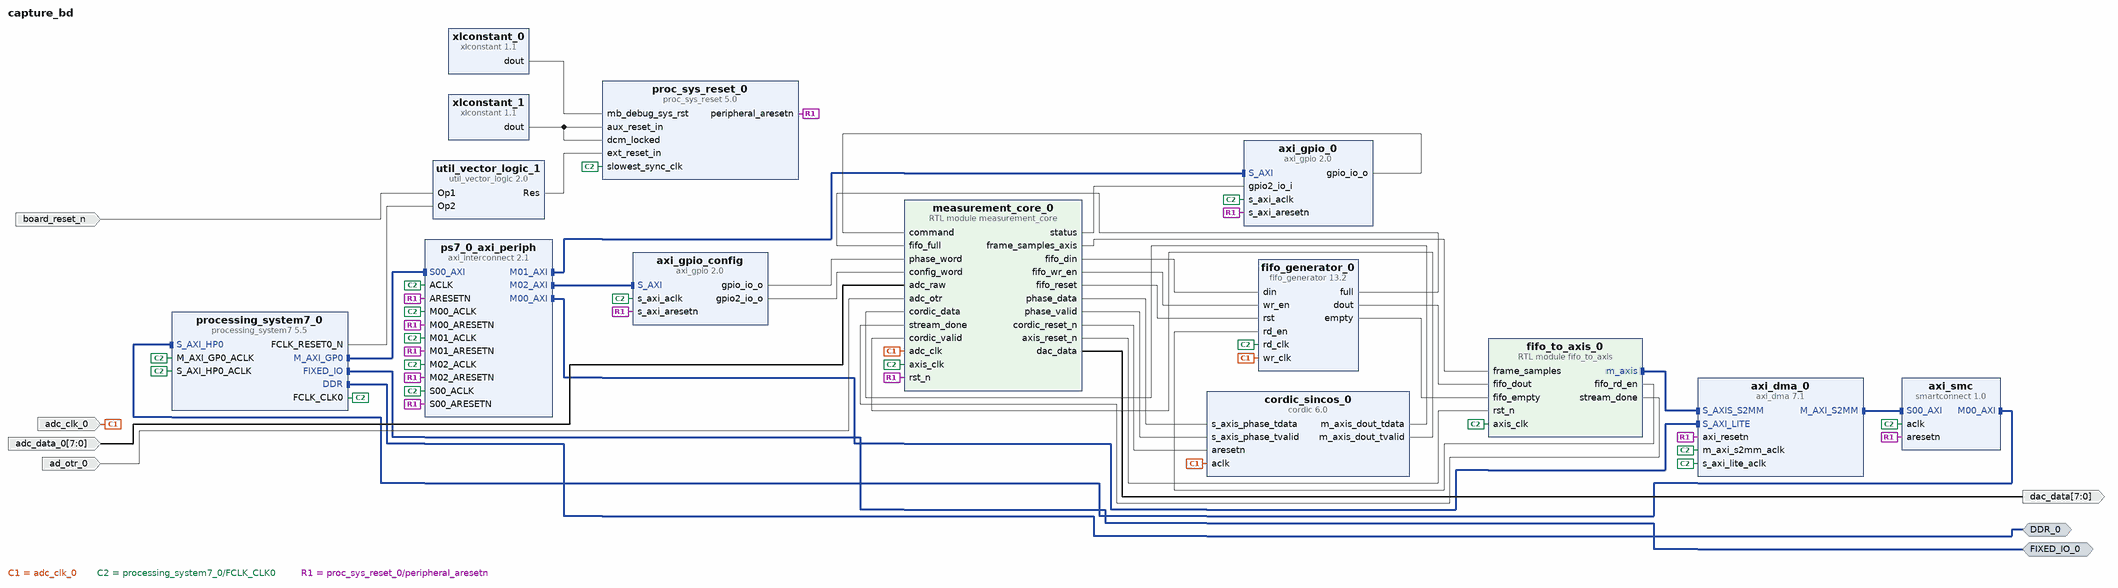
[diagram p0: block diagram of the top level]
# Vivado block design capture_bd, xc7z035ffg900-2, Vivado 2018.3
create_bd_design capture_bd

create_bd_intf_port -mode Master -vlnv xilinx.com:interface:ddrx_rtl:1.0 DDR_0
create_bd_intf_port -mode Master -vlnv xilinx.com:display_processing_system7:fixedio_rtl:1.0 FIXED_IO_0
create_bd_port -dir I -type clk adc_clk_0
set_property -dict {CONFIG.CLK_DOMAIN capture_bd_adc_clk_0 CONFIG.FREQ_HZ 10000000} [get_bd_ports adc_clk_0]
create_bd_port -dir I -from 7 -to 0 adc_data_0
create_bd_port -dir I -type rst board_reset_n
set_property -dict {CONFIG.POLARITY ACTIVE_LOW} [get_bd_ports board_reset_n]
create_bd_port -dir I ad_otr_0
create_bd_port -dir O -from 7 -to 0 dac_data

create_bd_cell -type ip -vlnv xilinx.com:ip:fifo_generator:13.2 fifo_generator_0
set_property -dict [list \
  CONFIG.Fifo_Implementation Independent_Clocks_Builtin_FIFO \
  CONFIG.Input_Data_Width 32 \
  CONFIG.Performance_Options First_Word_Fall_Through \
] [get_bd_cells fifo_generator_0]
create_bd_cell -type ip -vlnv xilinx.com:ip:axi_dma:7.1 axi_dma_0
set_property -dict {CONFIG.c_include_mm2s 0 CONFIG.c_include_sg 0} [get_bd_cells axi_dma_0]
create_bd_cell -type ip -vlnv xilinx.com:ip:processing_system7:5.5 processing_system7_0
set_property -dict [list \
  CONFIG.PCW_FPGA0_PERIPHERAL_FREQMHZ 100 \
  CONFIG.PCW_PRESET_BANK1_VOLTAGE {LVCMOS 3.3V} \
  CONFIG.PCW_S_AXI_HP0_DATA_WIDTH 32 \
  CONFIG.PCW_UART0_PERIPHERAL_ENABLE 1 \
  CONFIG.PCW_UART0_UART0_IO {MIO 14 .. 15} \
  CONFIG.PCW_UART_PERIPHERAL_FREQMHZ 100 \
  CONFIG.PCW_UIPARAM_DDR_FREQ_MHZ 533.333333 \
  CONFIG.PCW_UIPARAM_DDR_MEMORY_TYPE {DDR 3 (Low Voltage)} \
  CONFIG.PCW_UIPARAM_DDR_PARTNO {MT41K256M16 RE-125} \
  CONFIG.PCW_USE_S_AXI_HP0 1 \
] [get_bd_cells processing_system7_0]
# 97 more settings of processing_system7_0 are not shown: defaults, MIO pin electricals, DDR timing, and values the tool derives
create_bd_cell -type ip -vlnv xilinx.com:ip:proc_sys_reset:5.0 proc_sys_reset_0
create_bd_cell -type ip -vlnv xilinx.com:ip:util_vector_logic:2.0 util_vector_logic_1
set_property -dict {CONFIG.C_SIZE 1} [get_bd_cells util_vector_logic_1]
create_bd_cell -type ip -vlnv xilinx.com:ip:xlconstant:1.1 xlconstant_0
set_property -dict {CONFIG.CONST_VAL 0} [get_bd_cells xlconstant_0]
create_bd_cell -type ip -vlnv xilinx.com:ip:xlconstant:1.1 xlconstant_1
set_property -dict {CONFIG.CONST_VAL 1} [get_bd_cells xlconstant_1]
create_bd_cell -type ip -vlnv xilinx.com:ip:axi_interconnect:2.1 ps7_0_axi_periph
set_property -dict {CONFIG.NUM_MI 3} [get_bd_cells ps7_0_axi_periph]
create_bd_cell -type ip -vlnv xilinx.com:ip:smartconnect:1.0 axi_smc
set_property -dict {CONFIG.NUM_SI 1} [get_bd_cells axi_smc]
create_bd_cell -type ip -vlnv xilinx.com:ip:axi_gpio:2.0 axi_gpio_0
set_property -dict [list \
  CONFIG.C_ALL_INPUTS_2 1 \
  CONFIG.C_ALL_OUTPUTS 1 \
  CONFIG.C_GPIO2_WIDTH 32 \
  CONFIG.C_GPIO_WIDTH 32 \
  CONFIG.C_IS_DUAL 1 \
] [get_bd_cells axi_gpio_0]
create_bd_cell -type ip -vlnv xilinx.com:ip:cordic:6.0 cordic_sincos_0
set_property -dict [list \
  CONFIG.ARESETN true \
  CONFIG.Architectural_Configuration Parallel \
  CONFIG.Coarse_Rotation true \
  CONFIG.Functional_Selection Sin_and_Cos \
  CONFIG.Input_Width 16 \
  CONFIG.Output_Width 16 \
  CONFIG.Phase_Format Scaled_Radians \
  CONFIG.Pipelining_Mode Maximum \
  CONFIG.Round_Mode Nearest_Even \
  CONFIG.flow_control NonBlocking \
] [get_bd_cells cordic_sincos_0]
create_bd_cell -type ip -vlnv xilinx.com:ip:axi_gpio:2.0 axi_gpio_config
set_property -dict [list \
  CONFIG.C_ALL_OUTPUTS 1 \
  CONFIG.C_ALL_OUTPUTS_2 1 \
  CONFIG.C_GPIO2_WIDTH 32 \
  CONFIG.C_GPIO_WIDTH 32 \
  CONFIG.C_IS_DUAL 1 \
] [get_bd_cells axi_gpio_config]
create_bd_cell -type module -reference measurement_core measurement_core_0
create_bd_cell -type module -reference fifo_to_axis fifo_to_axis_0

# ---- connections ----

connect_bd_intf_net [get_bd_intf_pins ps7_0_axi_periph/M02_AXI] [get_bd_intf_pins axi_gpio_config/S_AXI]
connect_bd_intf_net [get_bd_intf_pins axi_dma_0/M_AXI_S2MM] [get_bd_intf_pins axi_smc/S00_AXI]
connect_bd_intf_net [get_bd_intf_pins ps7_0_axi_periph/M01_AXI] [get_bd_intf_pins axi_gpio_0/S_AXI]
connect_bd_intf_net [get_bd_intf_pins fifo_to_axis_0/m_axis] [get_bd_intf_pins axi_dma_0/S_AXIS_S2MM]
connect_bd_intf_net [get_bd_intf_pins axi_smc/M00_AXI] [get_bd_intf_pins processing_system7_0/S_AXI_HP0]
connect_bd_intf_net [get_bd_intf_pins ps7_0_axi_periph/M00_AXI] [get_bd_intf_pins axi_dma_0/S_AXI_LITE]
connect_bd_intf_net [get_bd_intf_pins processing_system7_0/M_AXI_GP0] [get_bd_intf_pins ps7_0_axi_periph/S00_AXI]
connect_bd_intf_net [get_bd_intf_ports FIXED_IO_0] [get_bd_intf_pins processing_system7_0/FIXED_IO]
connect_bd_intf_net [get_bd_intf_ports DDR_0] [get_bd_intf_pins processing_system7_0/DDR]
connect_bd_net -net adc_capture_pack_0_fifo_din [get_bd_pins measurement_core_0/fifo_din] [get_bd_pins fifo_generator_0/din]
connect_bd_net -net adc_capture_pack_0_fifo_wr_en [get_bd_pins measurement_core_0/fifo_wr_en] [get_bd_pins fifo_generator_0/wr_en]
connect_bd_net [get_bd_pins fifo_generator_0/full] [get_bd_pins measurement_core_0/fifo_full]
connect_bd_net -net adc_clk_0_1 [get_bd_ports adc_clk_0] \
  [get_bd_pins fifo_generator_0/wr_clk] [get_bd_pins cordic_sincos_0/aclk] [get_bd_pins measurement_core_0/adc_clk]
connect_bd_net -net adc_data_0_1 [get_bd_ports adc_data_0] [get_bd_pins measurement_core_0/adc_raw]
connect_bd_net [get_bd_pins fifo_generator_0/dout] [get_bd_pins fifo_to_axis_0/fifo_dout]
connect_bd_net [get_bd_pins fifo_generator_0/empty] [get_bd_pins fifo_to_axis_0/fifo_empty]
connect_bd_net [get_bd_pins fifo_to_axis_0/fifo_rd_en] [get_bd_pins fifo_generator_0/rd_en]
connect_bd_net [get_bd_pins processing_system7_0/FCLK_CLK0] \
  [get_bd_pins processing_system7_0/M_AXI_GP0_ACLK] [get_bd_pins processing_system7_0/S_AXI_HP0_ACLK] \
  [get_bd_pins axi_dma_0/s_axi_lite_aclk] [get_bd_pins axi_dma_0/m_axi_s2mm_aclk] [get_bd_pins fifo_generator_0/rd_clk] \
  [get_bd_pins proc_sys_reset_0/slowest_sync_clk] [get_bd_pins ps7_0_axi_periph/ACLK] [get_bd_pins ps7_0_axi_periph/S00_ACLK] \
  [get_bd_pins ps7_0_axi_periph/M00_ACLK] [get_bd_pins axi_smc/aclk] [get_bd_pins axi_gpio_0/s_axi_aclk] \
  [get_bd_pins ps7_0_axi_periph/M01_ACLK] [get_bd_pins axi_gpio_config/s_axi_aclk] [get_bd_pins ps7_0_axi_periph/M02_ACLK] \
  [get_bd_pins measurement_core_0/axis_clk] [get_bd_pins fifo_to_axis_0/axis_clk]
connect_bd_net [get_bd_pins processing_system7_0/FCLK_RESET0_N] [get_bd_pins util_vector_logic_1/Op2]
connect_bd_net [get_bd_pins util_vector_logic_1/Res] [get_bd_pins proc_sys_reset_0/ext_reset_in]
connect_bd_net [get_bd_pins xlconstant_0/dout] [get_bd_pins proc_sys_reset_0/mb_debug_sys_rst]
connect_bd_net [get_bd_pins xlconstant_1/dout] [get_bd_pins proc_sys_reset_0/dcm_locked] [get_bd_pins proc_sys_reset_0/aux_reset_in]
connect_bd_net [get_bd_pins proc_sys_reset_0/peripheral_aresetn] \
  [get_bd_pins axi_dma_0/axi_resetn] [get_bd_pins ps7_0_axi_periph/S00_ARESETN] [get_bd_pins ps7_0_axi_periph/M00_ARESETN] \
  [get_bd_pins ps7_0_axi_periph/ARESETN] [get_bd_pins axi_smc/aresetn] [get_bd_pins axi_gpio_0/s_axi_aresetn] \
  [get_bd_pins ps7_0_axi_periph/M01_ARESETN] [get_bd_pins axi_gpio_config/s_axi_aresetn] \
  [get_bd_pins ps7_0_axi_periph/M02_ARESETN] [get_bd_pins measurement_core_0/rst_n]
connect_bd_net [get_bd_pins fifo_to_axis_0/stream_done] [get_bd_pins measurement_core_0/stream_done]
connect_bd_net [get_bd_pins axi_gpio_0/gpio_io_o] [get_bd_pins measurement_core_0/command]
connect_bd_net -net adc_board_control_0_status [get_bd_pins measurement_core_0/status] [get_bd_pins axi_gpio_0/gpio2_io_i]
connect_bd_net [get_bd_ports board_reset_n] [get_bd_pins util_vector_logic_1/Op1]
connect_bd_net -net ad_otr_0_1 [get_bd_ports ad_otr_0] [get_bd_pins measurement_core_0/adc_otr]
connect_bd_net [get_bd_pins axi_gpio_config/gpio_io_o] [get_bd_pins measurement_core_0/phase_word]
connect_bd_net [get_bd_pins axi_gpio_config/gpio2_io_o] [get_bd_pins measurement_core_0/config_word]
connect_bd_net [get_bd_pins measurement_core_0/frame_samples_axis] [get_bd_pins fifo_to_axis_0/frame_samples]
connect_bd_net [get_bd_pins measurement_core_0/phase_data] [get_bd_pins cordic_sincos_0/s_axis_phase_tdata]
connect_bd_net [get_bd_pins measurement_core_0/phase_valid] [get_bd_pins cordic_sincos_0/s_axis_phase_tvalid]
connect_bd_net [get_bd_pins measurement_core_0/cordic_reset_n] [get_bd_pins cordic_sincos_0/aresetn]
connect_bd_net [get_bd_pins cordic_sincos_0/m_axis_dout_tdata] [get_bd_pins measurement_core_0/cordic_data]
connect_bd_net [get_bd_pins cordic_sincos_0/m_axis_dout_tvalid] [get_bd_pins measurement_core_0/cordic_valid]
connect_bd_net [get_bd_pins measurement_core_0/fifo_reset] [get_bd_pins fifo_generator_0/rst]
connect_bd_net [get_bd_pins measurement_core_0/axis_reset_n] [get_bd_pins fifo_to_axis_0/rst_n]
connect_bd_net [get_bd_pins measurement_core_0/dac_data] [get_bd_ports dac_data]

# ---- address map ----
assign_bd_address -offset 0x00000000 -range 512M -target_address_space [get_bd_addr_spaces axi_dma_0/Data_S2MM] [get_bd_addr_segs processing_system7_0/S_AXI_HP0/HP0_DDR_LOWOCM]
assign_bd_address -offset 0x40400000 -range 64K -target_address_space [get_bd_addr_spaces processing_system7_0/Data] [get_bd_addr_segs axi_dma_0/S_AXI_LITE/Reg]
assign_bd_address -offset 0x41200000 -range 64K -target_address_space [get_bd_addr_spaces processing_system7_0/Data] [get_bd_addr_segs axi_gpio_0/S_AXI/Reg]
assign_bd_address -offset 0x41210000 -range 64K -target_address_space [get_bd_addr_spaces processing_system7_0/Data] [get_bd_addr_segs axi_gpio_config/S_AXI/Reg]

validate_bd_design
save_bd_design
